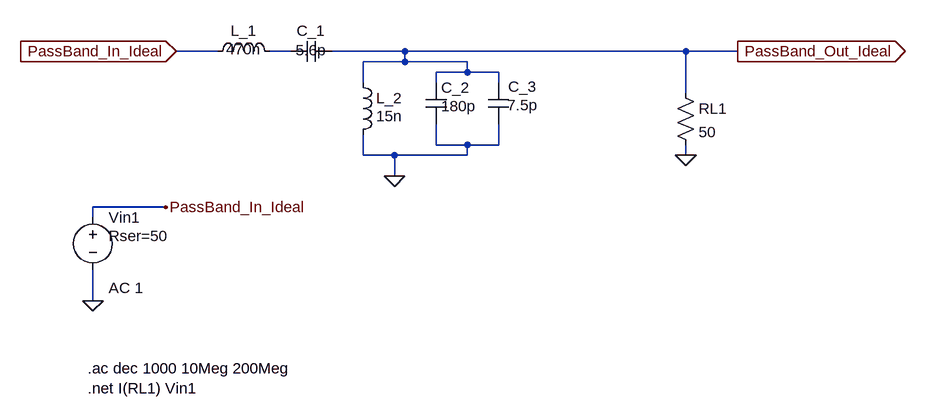
[diagram p0: schematic passaBanda98MHz_ideal.asc]
passaBanda98MHz_ideal.asc, the LTspice schematic file:
Version 4.1
SHEET 1 976 680
WIRE -128 96 -192 96
WIRE -16 96 -48 96
WIRE 160 96 48 96
WIRE 592 96 160 96
WIRE 672 96 592 96
WIRE 160 112 160 96
WIRE 160 112 96 112
WIRE 256 112 160 112
WIRE 256 128 256 112
WIRE 256 128 208 128
WIRE 304 128 256 128
WIRE 96 144 96 112
WIRE 208 144 208 128
WIRE 304 144 304 128
WIRE 592 160 592 96
WIRE 208 240 208 208
WIRE 256 240 208 240
WIRE 304 240 304 208
WIRE 304 240 256 240
WIRE 96 256 96 224
WIRE 144 256 96 256
WIRE 256 256 256 240
WIRE 256 256 144 256
WIRE 592 256 592 240
WIRE 144 288 144 256
WIRE -208 336 -320 336
WIRE -320 352 -320 336
WIRE -320 480 -320 432
FLAG 144 288 0
FLAG -192 96 PassBand_In_Ideal
IOPIN -192 96 In
FLAG 672 96 PassBand_Out_Ideal
IOPIN 672 96 Out
FLAG -320 480 0
FLAG -208 336 PassBand_In_Ideal
FLAG 592 256 0
SYMBOL ind -144 112 R270
WINDOW 0 32 56 VTop 2
WINDOW 3 4 56 VTop 2
SYMATTR InstName L_1
SYMATTR Value 470n
SYMBOL ind 80 128 R0
WINDOW 3 36 68 Left 2
SYMATTR InstName L_2
SYMATTR Value 15n
SYMBOL cap 48 80 R90
WINDOW 0 0 32 VBottom 2
WINDOW 3 14 32 VCenter 2
SYMATTR InstName C_1
SYMATTR Value 5.6p
SYMBOL cap 192 144 R0
WINDOW 3 24 36 Left 2
SYMATTR InstName C_2
SYMATTR Value 180p
SYMBOL voltage -320 336 R0
WINDOW 123 24 124 Left 2
WINDOW 39 24 44 Left 2
SYMATTR Value2 AC 1
SYMATTR SpiceLine Rser=50
SYMATTR InstName Vin1
SYMATTR Value ""
SYMBOL res 576 144 R0
SYMATTR InstName RL1
SYMATTR Value 50
SYMBOL cap 288 144 R0
WINDOW 0 53 22 Bottom 2
WINDOW 3 53 50 Bottom 2
SYMATTR InstName C_3
SYMATTR Value 7.5p
TEXT -328 584 Left 2 !.ac dec 1000 10Meg 200Meg\n.net I(RL1) Vin1

The netlist it stands for:
* passaBanda98MHz_ideal.asc
L_1 PassBand_In_Ideal N001 470n
L_2 PassBand_Out_Ideal 0 15n
C_1 PassBand_Out_Ideal N001 5.6p
C_2 PassBand_Out_Ideal 0 180p
Vin1 PassBand_In_Ideal 0 AC 1 Rser=50
RL1 PassBand_Out_Ideal 0 50
C_3 PassBand_Out_Ideal 0 7.5p
.ac dec 1000 10Meg 200Meg
.net I(RL1) Vin1
.backanno
.end